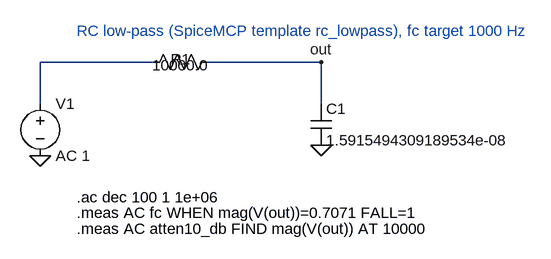
[diagram p0: schematic rc_lowpass.asc]
rc_lowpass.asc, the LTspice schematic file:
Version 4.1
SHEET 1 1600 1200
WIRE 112 0 -64 0
WIRE -64 0 -64 64
WIRE 368 64 368 0
WIRE 368 0 192 0
FLAG 368 0 out
FLAG -64 144 0
FLAG 368 128 0
SYMBOL res 96 16 R270
WINDOW 0 36 56 VBottom 2
WINDOW 3 -4 56 VTop 2
SYMATTR InstName R1
SYMATTR Value 10000.0
SYMBOL cap 352 64 R0
SYMATTR InstName C1
SYMATTR Value 1.5915494309189534e-08
SYMBOL voltage -64 48 R0
SYMATTR InstName V1
SYMATTR Value AC 1
TEXT -8 -48 Left 2 ;RC low-pass (SpiceMCP template rc_lowpass), fc target 1000 Hz
TEXT -8 208 Left 2 !.ac dec 100 1 1e+06
TEXT -8 232 Left 2 !.meas AC fc WHEN mag(V(out))=0.7071 FALL=1
TEXT -8 256 Left 2 !.meas AC atten10_db FIND mag(V(out)) AT 10000

The netlist it stands for:
* rc_lowpass.asc
R1 N001 out 10000.0
C1 out 0 1.5915494309189534e-08
V1 N001 0 AC 1
* RC low-pass (SpiceMCP template rc_lowpass), fc target 1000 Hz
.ac dec 100 1 1e+06
.meas AC fc WHEN mag(V(out))=0.7071 FALL=1
.meas AC atten10_db FIND mag(V(out)) AT 10000
.backanno
.end